# Altium schematic sheet CommunicationInterfaces.SchDoc: Interfaces de comunicação
size 420 x 297 mm; Author: Matheus Markies; DrawnBy: Matheus Markies; Engineer: Matheus Markies; DocumentNumber: ECTU-SCH-02; Revision: A definir; SheetNumber: 2; SheetTotal: 12; ProjectTitle: ROUTE ECU / ECTU; DocumentStatus: Em desenvolvimento; DocumentDate: 14/10/2026
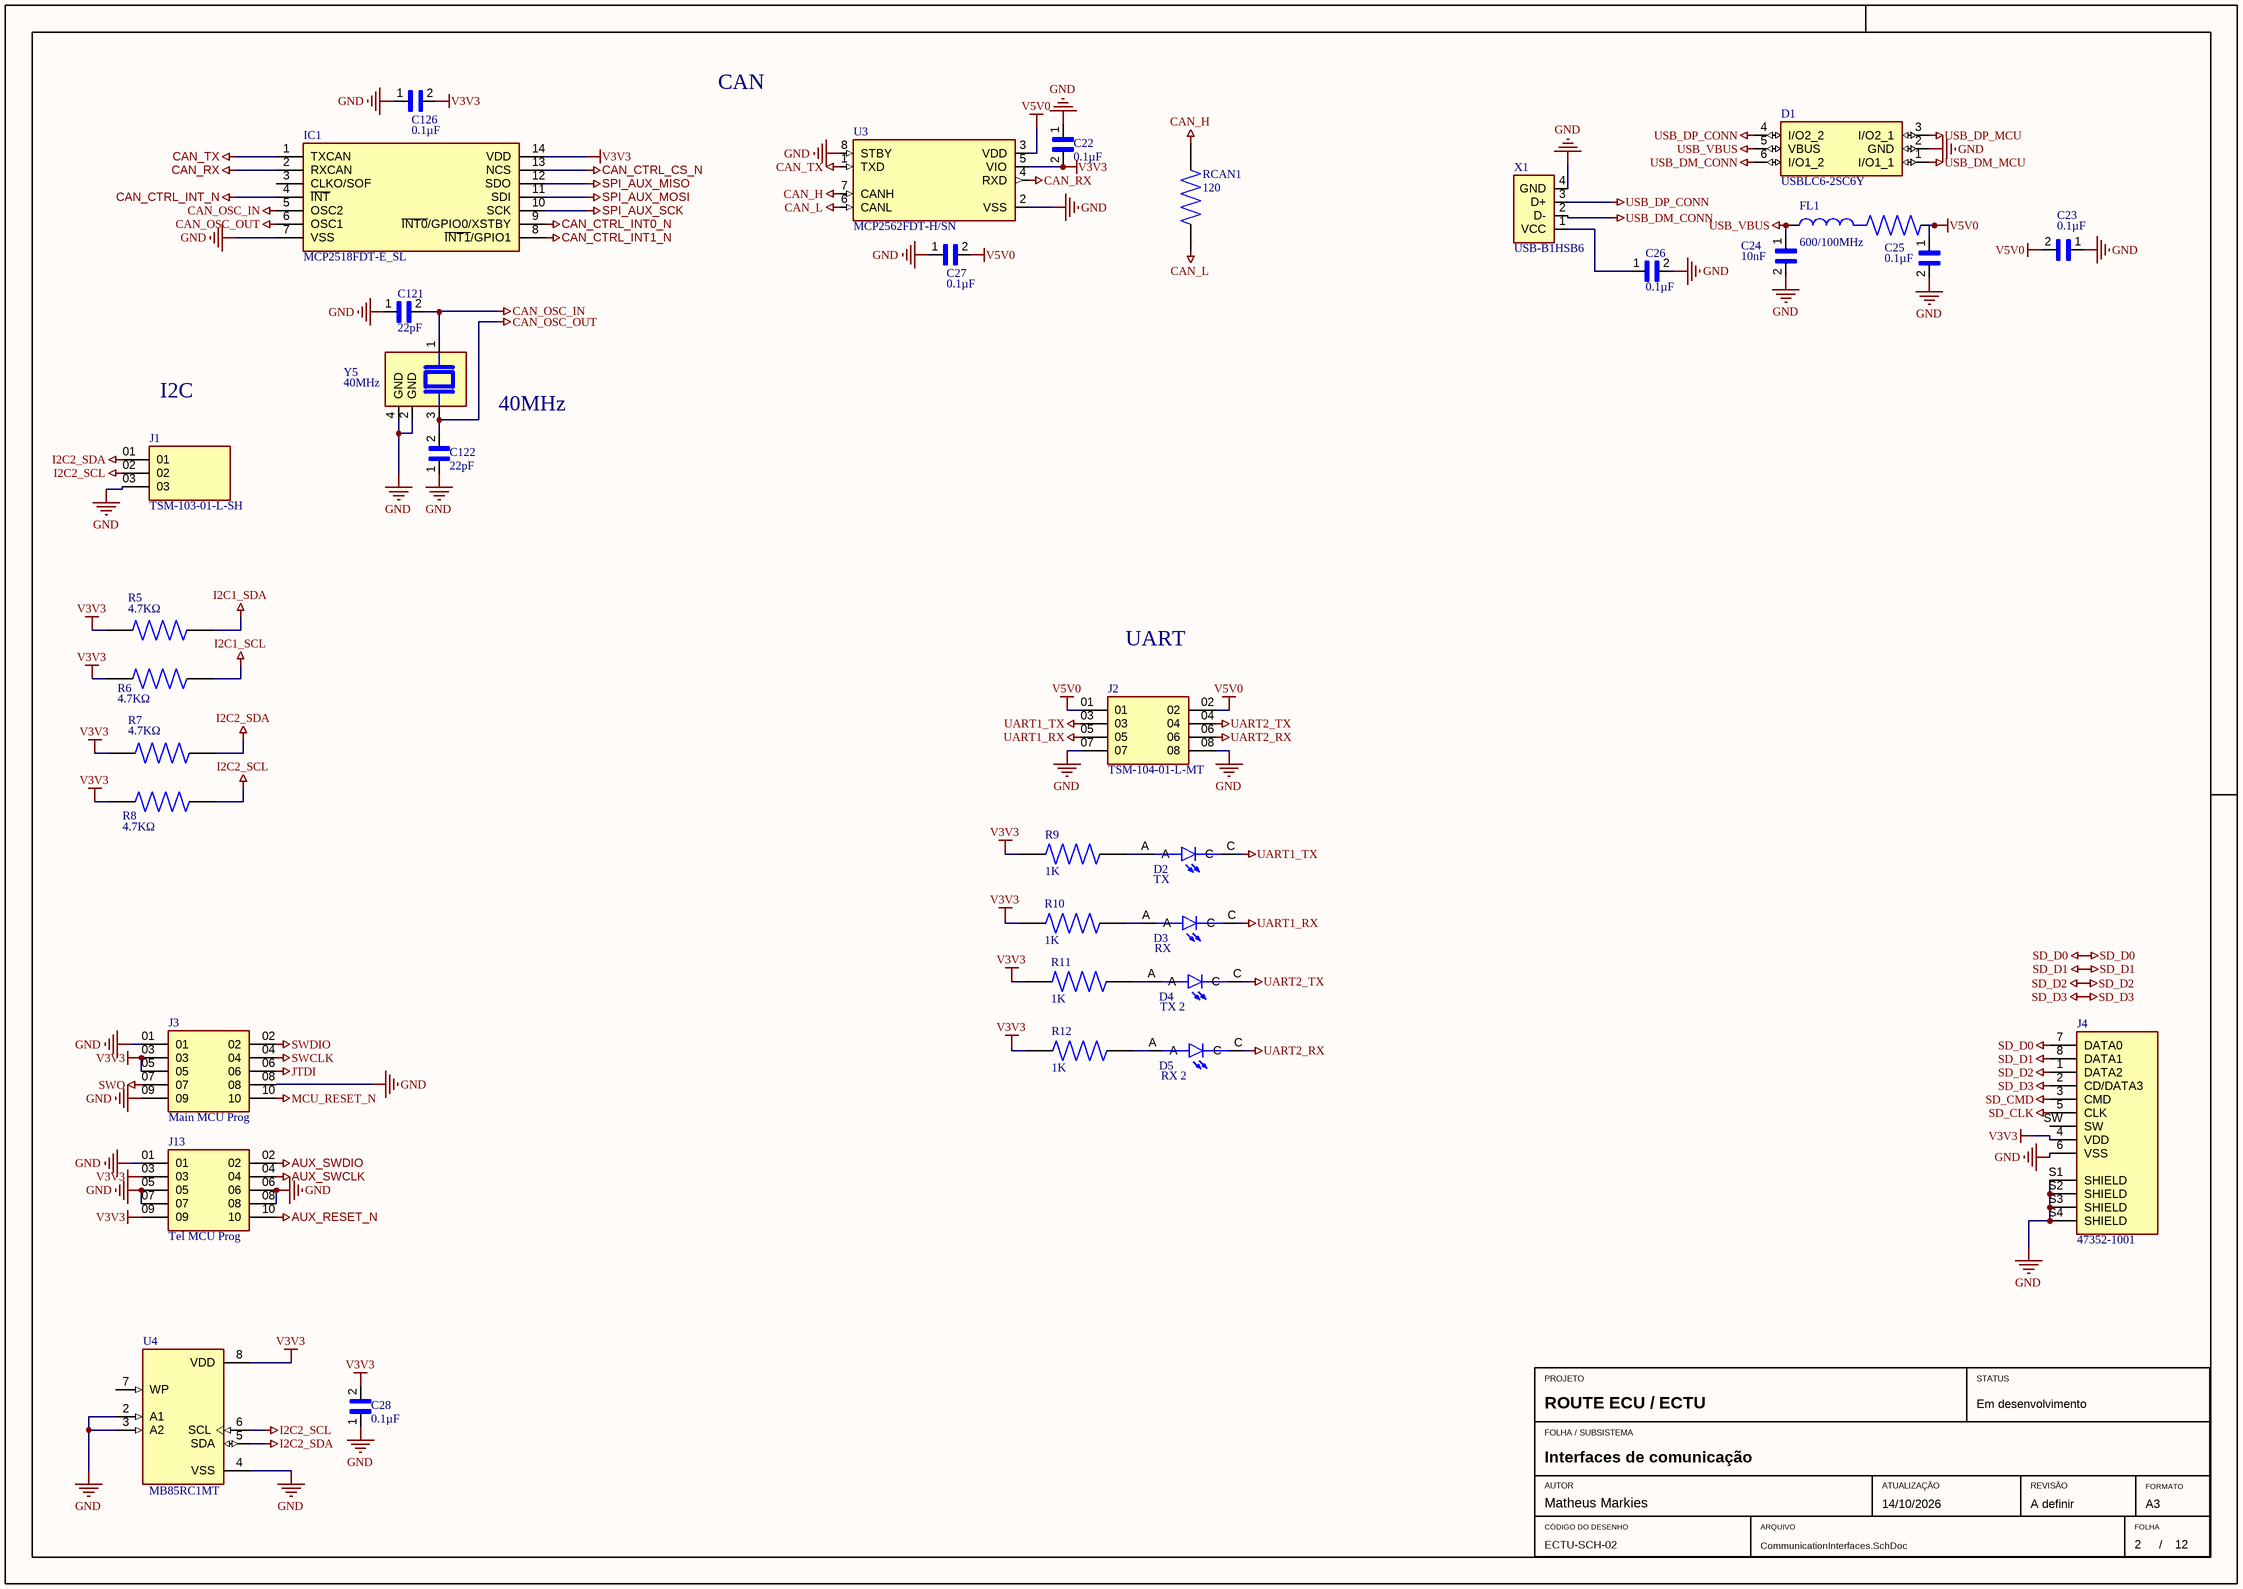
[diagram p0: CommunicationInterfaces.SchDoc]

## Parts
C22  0.1µF  [CAPC1608X90N]
C23  0.1µF  [CAPC1608X90N]
C24  10nF  [CAPC1608X90N]
C25  0.1µF  [CAPC1608X90N]
C26  0.1µF  [CAPC1608X90N]
C27  0.1µF  [CAPC1608X90N]
C28  0.1µF  [CAPC1608X90N]
C121  22pF  [CAPC1608X90N]
C122  22pF  [CAPC1608X90N]
C126  0.1µF  [CAPC1608X90N]
D1  USBLC6-2SC6Y  [SOT95P280X145-6N]
D2  TX  [LEDC2012X70N]
D3  RX  [LEDC2012X70N]
D4  TX 2  [LEDC2012X70N]
D5  RX 2  [LEDC2012X70N]
FL1  600/100MHz  [BEADC1608X95N]
IC1  MCP2518FDT-E_SL  [SOIC127P600X175-14N]
J1  TSM-103-01-L-SH  [SAMTEC-A-TSM-103-01-L-SH]
J2  TSM-104-01-L-MT  [SAMTEC_TSM-104-01-L-MT]
J3  Main MCU Prog  [SAMTEC_TSM-105-01-LM-DV-P-TR]
J4  47352-1001  [MOLEX_47352-1001]
J13  Tel MCU Prog  [SAMTEC_TSM-105-01-LM-DV-P-TR]
R5  4.7KΩ  [RES_ERJS06J472V]
R6  4.7KΩ  [RES_ERJS06J472V]
R7  4.7KΩ  [RES_ERJS06J472V]
R8  4.7KΩ  [RES_ERJS06J472V]
R9  1K  [RESC3116X65N]
R10  1K  [RESC3116X65N]
R11  1K  [RESC3116X65N]
R12  1K  [RESC3116X65N]
RCAN1  120  [RESC3116X65N]
U3  MCP2562FDT-H/SN  [SOIC127P600X175-8N]
U4  MB85RC1MT  [SOIC127P600X175-8N]
X1  USB-B1HSB6  [OST_USB-B1HSB6]
Y5  40MHz  [XTAL_7M25090002]

## Nets
AUX_RESET_N: J13.10
AUX_SWCLK: J13.04
AUX_SWDIO: J13.02
CAN_CTRL_CS_N: IC1.13(NCS)
CAN_CTRL_INT0_N: IC1.9(~{INT0}/GPIO0/XSTBY)
CAN_CTRL_INT1_N: IC1.8(~{INT1}/GPIO1)
CAN_CTRL_INT_N: IC1.4(~{INT})
CAN_H: RCAN1.2 U3.7(CANH)
CAN_L: RCAN1.1 U3.6(CANL)
CAN_OSC_IN: C121.2 IC1.5(OSC2) Y5.1
CAN_OSC_OUT: C122.2 IC1.6(OSC1) Y5.3
CAN_RX: IC1.2(RXCAN) U3.4(RXD)
CAN_TX: IC1.1(TXCAN) U3.1(TXD)
GND: C22.1 C23.1 C24.2 C25.2 C26.2 C27.1 C28.1 C121.1 C122.1 C126.1 D1.2(GND) IC1.7(VSS) J1.03 J2.07 J2.08 J3.01 J3.08 J3.09 J4.6(VSS) J4.S1(SHIELD) J4.S2(SHIELD) J4.S3(SHIELD) J4.S4(SHIELD) J13.01 J13.05 J13.06 J13.07 J13.08 U3.2(VSS) U3.8(STBY) U4.2(A1) U4.3(A2) U4.4(VSS) X1.4(GND) Y5.2(GND) Y5.4(GND)
I2C1_SCL: R6.2
I2C1_SDA: R5.1
I2C2_SCL: J1.02 R8.2 U4.6(SCL)
I2C2_SDA: J1.01 R7.1 U4.5(SDA)
JTDI: J3.06
MCU_RESET_N: J3.10
SD_CLK: J4.5(CLK)
SD_CMD: J4.3(CMD)
SD_D0: J4.7(DATA0)
SD_D1: J4.8(DATA1)
SD_D2: J4.1(DATA2)
SD_D3: J4.2(CD/DATA3)
SPI_AUX_MISO: IC1.12(SDO)
SPI_AUX_MOSI: IC1.11(SDI)
SPI_AUX_SCK: IC1.10(SCK)
SWCLK: J3.04
SWDIO: J3.02
SWO: J3.07
UART1_RX: D3.C J2.05
UART1_TX: D2.C J2.03
UART2_RX: D5.C J2.06
UART2_TX: D4.C J2.04
USB_DM_CONN: D1.6(I/O1_2) X1.2(D-)
USB_DM_MCU: D1.1(I/O1_1)
USB_DP_CONN: D1.4(I/O2_2) X1.3(D+)
USB_DP_MCU: D1.3(I/O2_1)
USB_VBUS: C24.1 D1.5(VBUS) FL1.1
V3V3: C22.2 C28.2 C126.2 IC1.14(VDD) J3.03 J3.05 J4.4(VDD) J13.03 J13.09 R5.2 R6.1 R7.2 R8.1 R9.1 R10.1 R11.1 R12.1 U3.5(VIO) U4.8(VDD)
V5V0: C23.2 C25.1 C27.2 FL1.2 J2.01 J2.02 U3.3(VDD)
NetC26_1: C26.1 X1.1(VCC)
NetD2_A: D2.A R9.2
NetD3_A: D3.A R10.2
NetD4_A: D4.A R11.2
NetD5_A: D5.A R12.2

Not connected (* = marked no-connect by the designer): IC1 3(CLKO/SOF); J4 SW; U4 7(WP)

## Notes on the sheet
- CAN
- I2C
- 40MHz
- UART
- PROJETO
- STATUS
- FOLHA / SUBSISTEMA
- AUTOR
- CÓDIGO DO DESENHO
- ARQUIVO
- ATUALIZAÇÃO
- REVISÃO
- FOLHA
- FORMATO
- A3
- /

## Library data of the parts
C22-C28 C121 C122 C126 = 06035C104MAZ2A: Multilayer Ceramic Capacitors MLCC - SMD/SMT; Package: None; Price: None; Value: *; MP: 06035C104MAZ2A; Availability: Unavailable
D1 = USBLC6-2SC6Y: 17V Clamp 5A (8/20µs) Ipp Tvs Diode Surface Mount SOT-23-6; MF: STMicroelectronics; SnapEDA_Link: https://www.snapeda.com/parts/USBLC6-2SC6Y/STMicroelectronics/view-part/?ref=snap; Package: SOT-23-6 STMicroelectronics; Value: *; MP: USBLC6-2SC6Y; Check_prices: https://www.snapeda.com/parts/USBLC6-2SC6Y/STMicroelectronics/view-part/?ref=eda
D2-D5 = 597-3305-607F: LED Uni-Color Green 4-Pin Chip 0805 T/R; Availability: Unavailable; Value: *; Price: None; MP: 597-3305-607F; Package: None
FL1 = BLM18DN601SZ1D: 600 Ohms @ 100MHz 1 Ferrite Bead 0603 _1608 Metric_ 700mA; MF: Murata; Package: 1608 Murata; Availability: Unavailable; Value: *; MP: BLM18DN601SZ1D; SnapEDA_Link: https://www.snapeda.com/parts/BLM18DN601SZ1D/Murata/view-part/4302620/?ref=snap; Price: None
IC1 = MCP2518FDT-E_SL: Integrated Circuit; Manufacturer_Name: Microchip; Manufacturer_Part_Number: MCP2518FDT-E/SL; Datasheet Link: https://datasheet.datasheetarchive.com/originals/distributors/Datasheets_SAMA/744760637e861ab0ee43f380fa65a694.pdf; Height: 1.75mm; Mouser Part Number: 579-MCP2518FDT-E/SL; Mouser Price/Stock: https://www.mouser.co.uk/ProductDetail/Microchip-Technology/MCP2518FDT-E-SL?qs=T3oQrply3y%2F7g%252BYAgK9Bdg%3D%3D; Arrow Part Number: MCP2518FDT-E/SL; Arrow Price/Stock: https://www.arrow.com/en/products/mcp2518fdt-esl/microchip-technology.html?utm_currency=USD&region=nac
J1 = TSM-103-01-L-SH: pin to pad: 01>1 02>2 03>3; MF: Samtec Inc.; Package: None; MP: TSM-103-01-L-SH; Value: *; Price: None; Availability: Unavailable
J2 = TSM-104-01-L-MT: TSM Series .100 Surface Mount Terminal Strip; MF: Samtec; SnapEDA_Link: https://www.snapeda.com/parts/TSM-104-01-L-MT/Samtec/view-part/?ref=snap; Package: None; Value: *; MP: TSM-104-01-L-MT; Check_prices: https://www.snapeda.com/parts/TSM-104-01-L-MT/Samtec/view-part/?ref=eda
J3 J13 = TSM-105-01-LM-DV-P-TR: TSM - Samtec 2.54mm Dual Row Vertical Surface Mount Header 5.84mm Post Height (01) - Fast Stock; Check_prices: https://www.snapeda.com/parts/TSM-105-01-LM-DV-P-TR/Samtec/view-part/3284031/?ref=eda; MF: Samtec; Package: None; Purchase-URL: https://pricing.snapeda.com/search/part/TSM-105-01-LM-DV-P-TR/?ref=eda; Availability: In Stock; Value: *; MP: TSM-105-01-LM-DV-P-TR; SnapEDA_Link: https://www.snapeda.com/parts/TSM-105-01-LM-DV-P-TR/Samtec/view-part/3284031/?ref=snap; Price: None
J4 = 47352-1001: 8 (6 + 2) Position Card Connector Secure Digital - microSDâ„¢ Surface Mount, Right Angle Gold; MP: 473521001; MF: Molex; Price: None; Availability: In Stock; Package: None; Value: *; Purchase-URL: https://pricing.snapeda.com/search/part/473521001/?ref=eda
R5-R8 = ERJS06J472V: Price: None; Availability: Unavailable; MP: ERJS06J472V; Package: None; Value: *
R9-R12 = RC1206JR-071KL: RES, THICK FILM, 1K, 5%, 0.25W, 1206; Resistance:1kohm; Resistance Tolerance:Â± 5%; Power Rating:250mW; Resistor Case Style:1206 ^3216 Metric]; Resistor Technology:Thick Film; Resistor Type:General Purpose; Product Range:RC Series; MF: Yageo Corporation; MP: RC1206JR071KL; SnapEDA_Link: https://www.snapeda.com/parts/RC1206JR071KL/Yageo/view-part/?ref=snap; Package: 1206-2 YAGEO; Value: *; Check_prices: https://www.snapeda.com/parts/RC1206JR071KL/Yageo/view-part/?ref=eda
RCAN1 = AA1206JR-07470RL: Package: None; Price: None; Value: *; MP: AA1206JR-07470RL; Availability: Unavailable
U3 = MCP2562FDT-H/SN: CAN Flexible Data Rate Transceiver | Microchip Technology Inc. MCP2562FDT-H/SN; SnapEDA_Link: https://www.snapeda.com/parts/MCP2562FDT-H/SN/Microchip/view-part/?ref=snap; Package: SO-8 Microchip; Value: *; MF: Microchip; MP: MCP2562FDT-H/SN; Check_prices: https://www.snapeda.com/parts/MCP2562FDT-H/SN/Microchip/view-part/?ref=eda
U4 = MB85RC1MTPNF-G-JNERE1: FRAM _Ferroelectric RAM_ Memory IC 1Mb _128K x 8_ IÂ²C 3.4MHz 130ns 8-SOP; MF: Fujitsu Electronics; MP: MB85RC1MTPNF-G-JNERE1; Price: None; SnapEDA_Link: https://www.snapeda.com/parts/MB85RC1MTPNF-G-JNERE1/Fujitsu%20Electronics%20America%2C%20Inc./view-part/2842124/?ref=snap; Availability: Unavailable; Value: *; Package: SO-8 Fujitsu
X1 = USB-B1HSB6: USB-B (USB TYPE-B) - Receptacle Connector 4 Position Through Hole, Right Angle; MF: On Shore; Check_prices: https://www.snapeda.com/parts/USB-B1HSB6/On+Shore+Technology+Inc./view-part/?ref=eda; Value: *; Purchase-URL: https://pricing.snapeda.com/search/part/USB-B1HSB6/?ref=eda; Price: None; MP: USB-B1HSB6; SnapEDA_Link: https://www.snapeda.com/parts/USB-B1HSB6/On+Shore+Technology+Inc./view-part/?ref=snap; Availability: In Stock; Package: None
Y5 = 7M25090002: 25 MHz Â±10ppm Crystal 18pF 4-SMD, No Lead; MF: TXC; Availability: In Stock; Check_prices: https://www.snapeda.com/parts/7M25090002/TXC/view-part/?ref=eda; Price: None; SnapEDA_Link: https://www.snapeda.com/parts/7M25090002/TXC/view-part/?ref=snap; MP: 7M25090002; Value: *; Purchase-URL: https://pricing.snapeda.com/search/part/7M25090002/?ref=eda; Package: SMD-4 TXC